# EAGLE design QTP-BAC 14.1 (EAGLE 7.5.0)
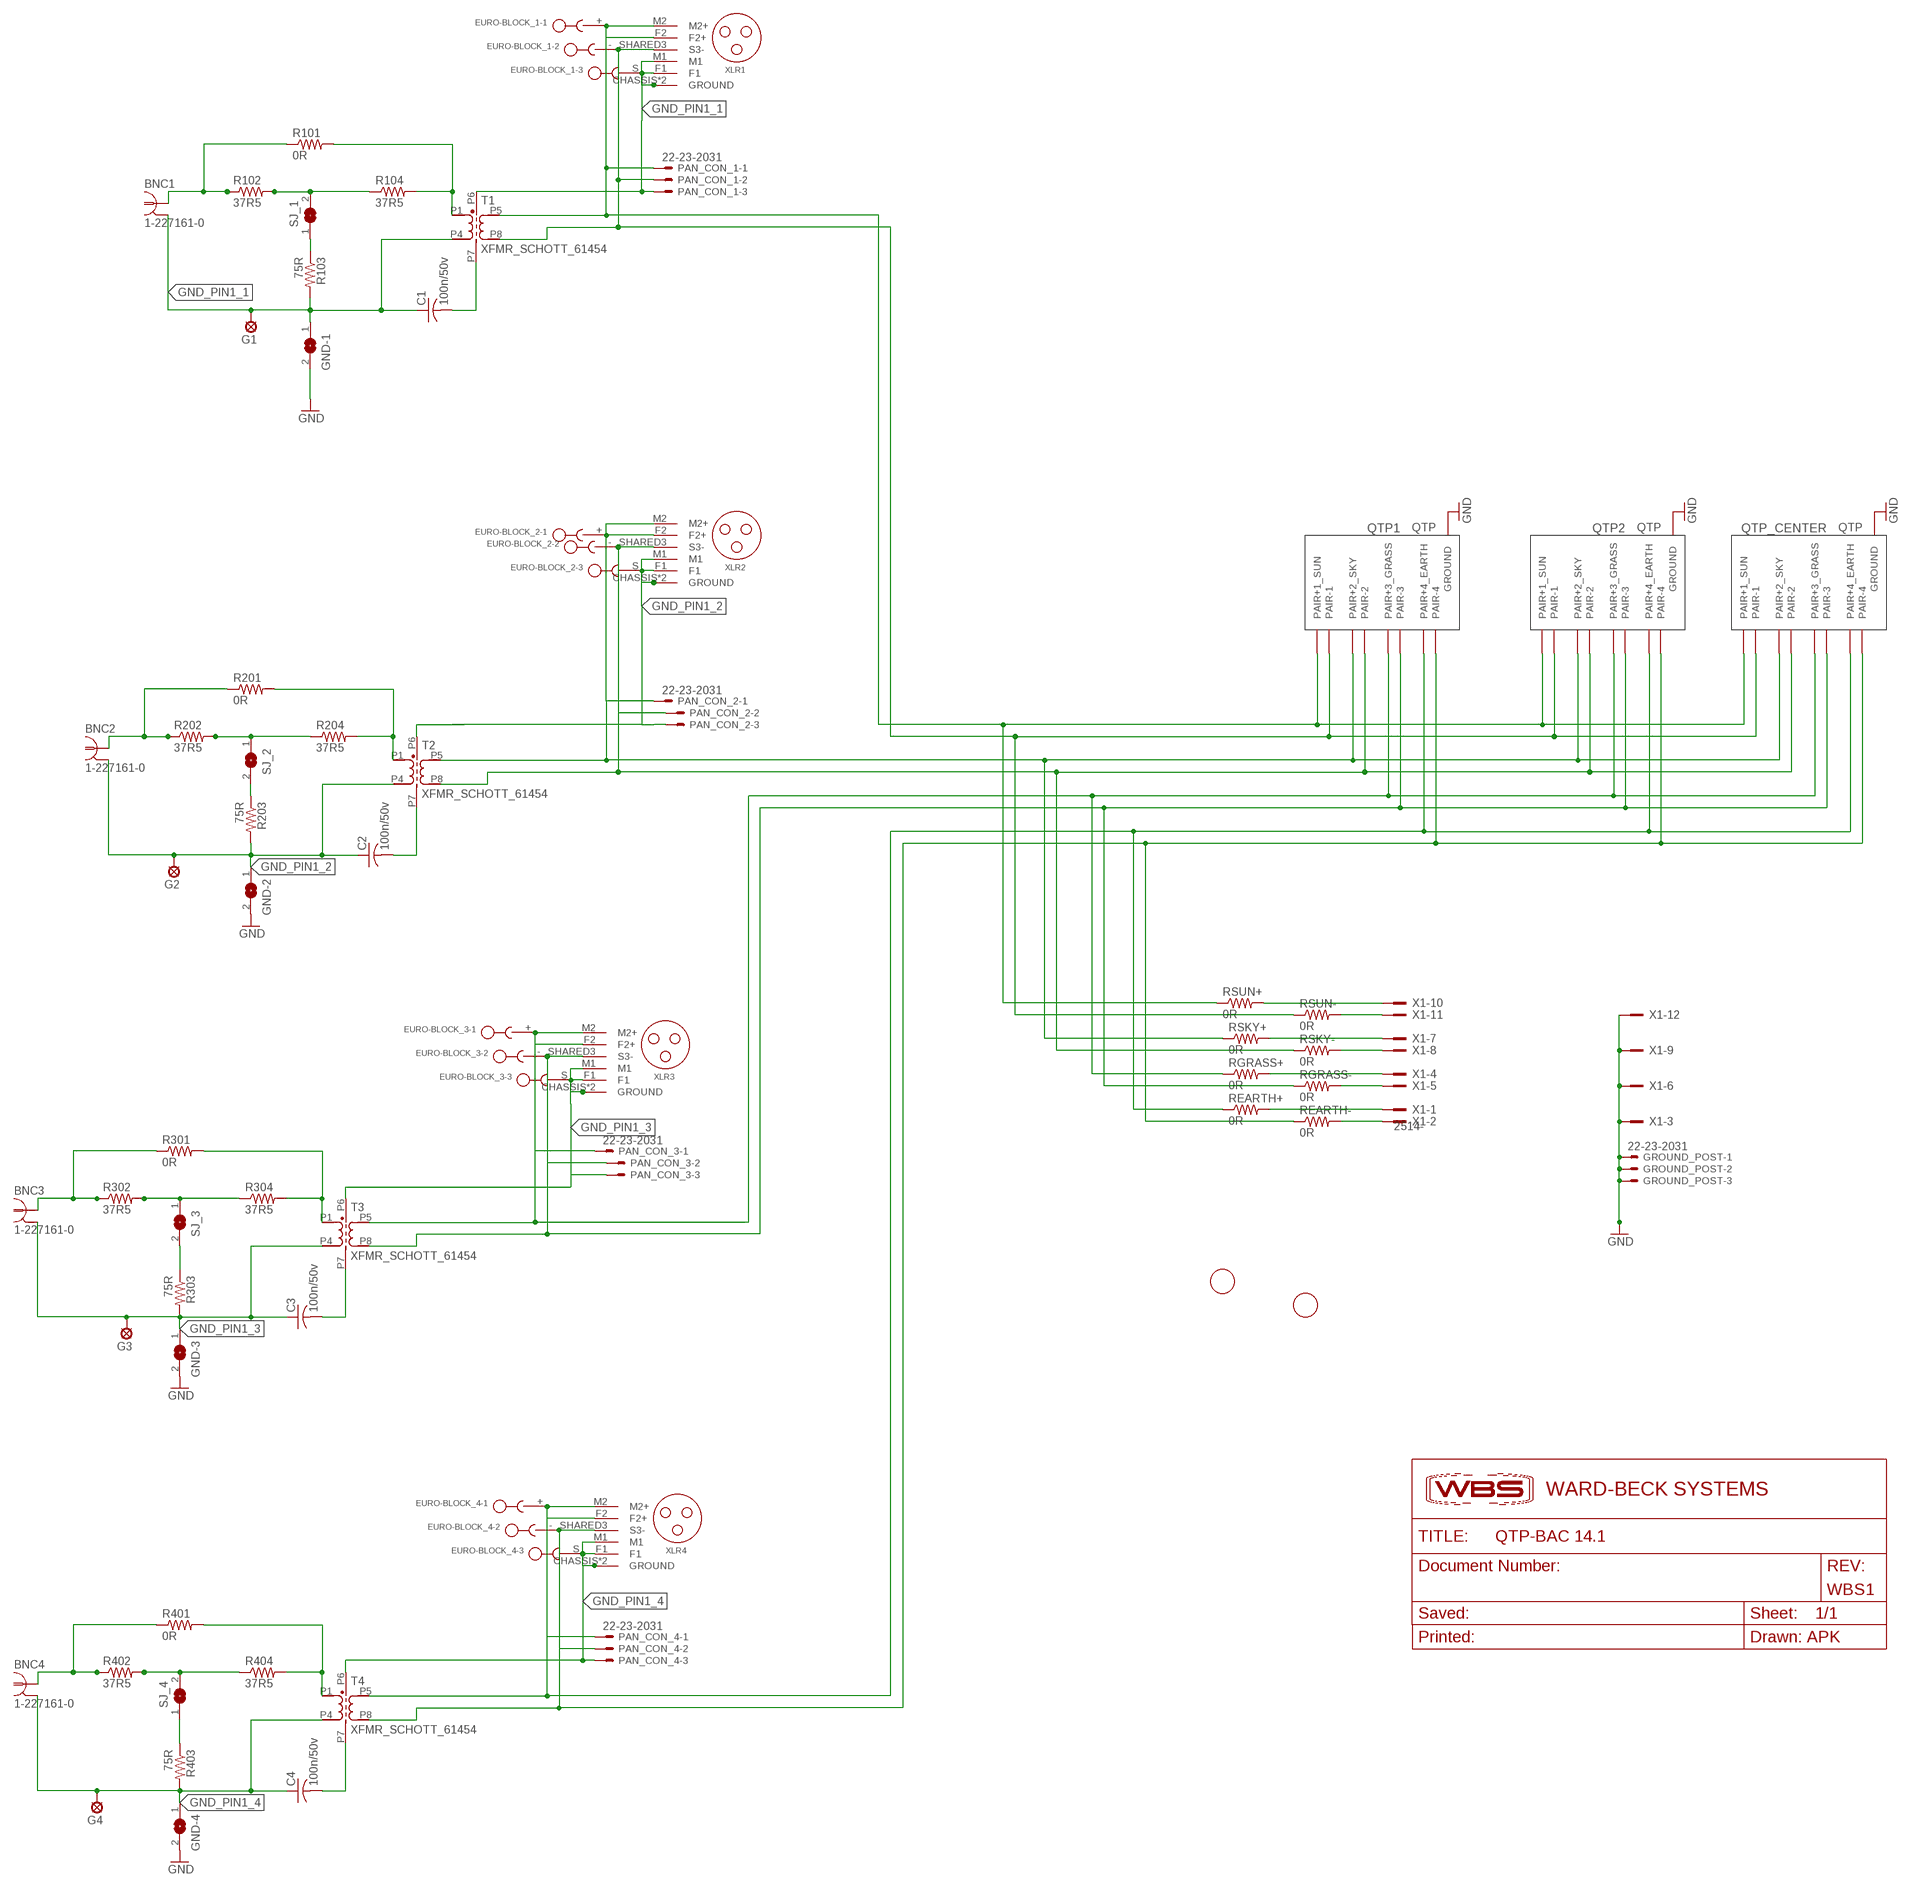
[diagram p0: schematic, sheet 1]

## Parts
BNC1  1-227161-0  [AMP_227161]
BNC2  1-227161-0  [AMP_227161]
BNC3  1-227161-0  [AMP_227161]
BNC4  1-227161-0  [AMP_227161]
C1  100n/50v  C-USC0805  [C0805]
C2  100n/50v  C-USC0805  [C0805]
C3  100n/50v  C-USC0805  [C0805]
C4  100n/50v  C-USC0805  [C0805]
EURO-BLOCK_1  CON-PHOENIX_RIGHT_ANGLE_3.81  [CON-PHOENIX_MC1.5/3-G-3.81]
EURO-BLOCK_2  CON-PHOENIX_RIGHT_ANGLE_3.81  [CON-PHOENIX_MC1.5/3-G-3.81]
EURO-BLOCK_3  CON-PHOENIX_RIGHT_ANGLE_3.81  [CON-PHOENIX_MC1.5/3-G-3.81]
EURO-BLOCK_4  CON-PHOENIX_RIGHT_ANGLE_3.81  [CON-PHOENIX_MC1.5/3-G-3.81]
G1  LSP10  [LSP10]
G2  LSP10  [LSP10]
G3  LSP10  [LSP10]
G4  LSP10  [LSP10]
GND-1  SJ  [SJ]
GND-2  SJ  [SJ]
GND-3  SJ  [SJ]
GND-4  SJ  [SJ]
GROUND_POST  22-23-2031  [22-23-2031]
PAN_CON_1  22-23-2031  [22-23-2031]
PAN_CON_2  22-23-2031  [22-23-2031]
PAN_CON_3  22-23-2031  [22-23-2031]
PAN_CON_4  22-23-2031  [22-23-2031]
QTP1  CON-QTP  [ASSMAN-RJ45]
QTP2  CON-QTP  [ASSMAN-RJ45]
QTP_CENTER  CON-QTP  [ASSMAN-RJ45]
R101  0R  R-US_R0805W  [R0805W]
R102  37R5  R-US_R0805W  [R0805W]
R103  75R  R-US_R0805W  [R0805W]
R104  37R5  R-US_R0805W  [R0805W]
R201  0R  R-US_R0805W  [R0805W]
R202  37R5  R-US_R0805W  [R0805W]
R203  75R  R-US_R0805W  [R0805W]
R204  37R5  R-US_R0805W  [R0805W]
R301  0R  R-US_R0805W  [R0805W]
R302  37R5  R-US_R0805W  [R0805W]
R303  75R  R-US_R0805W  [R0805W]
R304  37R5  R-US_R0805W  [R0805W]
R401  0R  R-US_R0805W  [R0805W]
R402  37R5  R-US_R0805W  [R0805W]
R403  75R  R-US_R0805W  [R0805W]
R404  37R5  R-US_R0805W  [R0805W]
REARTH+  0R  R-US_R0805W  [R0805W]
REARTH-  0R  R-US_R0805W  [R0805W]
RGRASS+  0R  R-US_R0805W  [R0805W]
RGRASS-  0R  R-US_R0805W  [R0805W]
RSKY+  0R  R-US_R0805W  [R0805W]
RSKY-  0R  R-US_R0805W  [R0805W]
RSUN+  0R  R-US_R0805W  [R0805W]
RSUN-  0R  R-US_R0805W  [R0805W]
SJ_1  SJ  [SJ]
SJ_2  SJ  [SJ]
SJ_3  SJ  [SJ]
SJ_4  SJ  [SJ]
T1  XFMR_SCHOTT_61454  [SCHOTT_61454]
T2  XFMR_SCHOTT_61454  [SCHOTT_61454]
T3  XFMR_SCHOTT_61454  [SCHOTT_61454]
T4  XFMR_SCHOTT_61454  [SCHOTT_61454]
U$1  FIDUCIAL  [FIDUCIAL_1MM]
U$2  FIDUCIAL  [FIDUCIAL_1MM]
WBS1  WBS-DOCUMENT_INFO_FRAME  [WBS-FRAME_PCB]
X1  2514-  [PAK100/2500-14]
XLR1  CON-XLR-NEUTRIK_A_BISEXUAL  [CON_NEUTRIK_A_BISEXUAL_H]
XLR2  CON-XLR-NEUTRIK_A_BISEXUAL  [CON_NEUTRIK_A_BISEXUAL_H]
XLR3  CON-XLR-NEUTRIK_A_BISEXUAL  [CON_NEUTRIK_A_BISEXUAL_H]
XLR4  CON-XLR-NEUTRIK_A_BISEXUAL  [CON_NEUTRIK_A_BISEXUAL_H]

## Nets
CH1+1 [Pair 1]: EURO-BLOCK_1.+ PAN_CON_1.1 QTP1.P1+(PAIR+1_SUN) QTP2.P1+(PAIR+1_SUN) QTP_CENTER.P1+(PAIR+1_SUN) RSUN+.1 T1.P5 XLR1.F2(F2+) XLR1.M2(M2+)
CH1-1 [Pair 1]: EURO-BLOCK_1.- PAN_CON_1.2 QTP1.P1-(PAIR-1) QTP2.P1-(PAIR-1) QTP_CENTER.P1-(PAIR-1) RSUN-.1 T1.P8 XLR1.SHARED3(S3-)
CH2+1 [Pair 2]: EURO-BLOCK_2.+ PAN_CON_2.1 QTP1.P2+(PAIR+2_SKY) QTP2.P2+(PAIR+2_SKY) QTP_CENTER.P2+(PAIR+2_SKY) RSKY+.1 T2.P5 XLR2.F2(F2+) XLR2.M2(M2+)
CH2-1 [Pair 2]: EURO-BLOCK_2.- PAN_CON_2.2 QTP1.P2-(PAIR-2) QTP2.P2-(PAIR-2) QTP_CENTER.P2-(PAIR-2) RSKY-.1 T2.P8 XLR2.SHARED3(S3-)
CH3+1 [Pair 3]: EURO-BLOCK_3.+ PAN_CON_3.1 QTP1.P3+(PAIR+3_GRASS) QTP2.P3+(PAIR+3_GRASS) QTP_CENTER.P3+(PAIR+3_GRASS) RGRASS+.1 T3.P5 XLR3.F2(F2+) XLR3.M2(M2+)
CH3-1 [Pair 3]: EURO-BLOCK_3.- PAN_CON_3.2 QTP1.P3-(PAIR-3) QTP2.P3-(PAIR-3) QTP_CENTER.P3-(PAIR-3) RGRASS-.1 T3.P8 XLR3.SHARED3(S3-)
CH4+1 [Pair 4]: EURO-BLOCK_4.+ PAN_CON_4.1 QTP1.P4+(PAIR+4_EARTH) QTP2.P4+(PAIR+4_EARTH) QTP_CENTER.P4+(PAIR+4_EARTH) REARTH+.1 T4.P5 XLR4.F2(F2+) XLR4.M2(M2+)
CH4-1 [Pair 4]: EURO-BLOCK_4.- PAN_CON_4.2 QTP1.P4-(PAIR-4) QTP2.P4-(PAIR-4) QTP_CENTER.P4-(PAIR-4) REARTH-.1 T4.P8 XLR4.SHARED3(S3-)
GND: GND-1.2 GND-2.2 GND-3.2 GND-4.2 GROUND_POST.1 GROUND_POST.2 GROUND_POST.3 QTP1.P$9(GROUND) QTP1.P$10(GROUND) QTP1.P$11(GROUND) QTP1.P$12(GROUND) QTP2.P$9(GROUND) QTP2.P$10(GROUND) QTP2.P$11(GROUND) QTP2.P$12(GROUND) QTP_CENTER.P$9(GROUND) QTP_CENTER.P$10(GROUND) QTP_CENTER.P$11(GROUND) QTP_CENTER.P$12(GROUND) X1.3 X1.6 X1.9 X1.12
GND_PIN1_1 [Pair 4]: BNC1.2 C1.1 EURO-BLOCK_1.S G1.MP GND-1.1 PAN_CON_1.3 R103.2 T1.P4 T1.P6 XLR1.CHASSIS(GROUND) XLR1.F1 XLR1.GROUND XLR1.M1
GND_PIN1_2 [Pair 4]: BNC2.2 C2.1 EURO-BLOCK_2.S G2.MP GND-2.1 PAN_CON_2.3 R203.2 T2.P4 T2.P6 XLR2.CHASSIS(GROUND) XLR2.F1 XLR2.GROUND XLR2.M1
GND_PIN1_3 [Pair 4]: BNC3.2 C3.1 EURO-BLOCK_3.S G3.MP GND-3.1 PAN_CON_3.3 R303.2 T3.P4 T3.P6 XLR3.CHASSIS(GROUND) XLR3.F1 XLR3.GROUND XLR3.M1
GND_PIN1_4 [Pair 4]: BNC4.2 C4.1 EURO-BLOCK_4.S G4.MP GND-4.1 PAN_CON_4.3 R403.2 T4.P4 T4.P6 XLR4.CHASSIS(GROUND) XLR4.F1 XLR4.GROUND XLR4.M1
N$1: R102.2 R104.1 SJ_1.2
N$2 [Pair 1]: C1.2 T1.P7
N$3 [Pair 1]: R101.2 R104.2 T1.P1
N$4: R103.1 SJ_1.1
N$5 [Pair 1]: BNC1.1 R101.1 R102.1
N$6: R203.1 SJ_2.2
N$7: R303.1 SJ_3.2
N$9 [Pair 2]: R201.2 R204.2 T2.P1
N$10 [Pair 2]: R202.2 R204.1 SJ_2.1
N$11 [Pair 2]: BNC2.1 R201.1 R202.1
N$12 [Pair 2]: C2.2 T2.P7
N$15: R403.1 SJ_4.1
N$22 [Pair 3]: R301.2 R304.2 T3.P1
N$23 [Pair 3]: R302.2 R304.1 SJ_3.1
N$24 [Pair 3]: BNC3.1 R301.1 R302.1
N$25 [Pair 3]: C3.2 T3.P7
N$35 [Pair 4]: R401.2 R404.2 T4.P1
N$36 [Pair 4]: R402.2 R404.1 SJ_4.2
N$37 [Pair 4]: BNC4.1 R401.1 R402.1
N$38 [Pair 4]: C4.2 T4.P7
N$39 [Pair 1]: REARTH-.2 X1.2
N$40 [Pair 1]: REARTH+.2 X1.1
N$41 [Pair 2]: RGRASS-.2 X1.5
N$46 [Pair 4]: RSUN+.2 X1.10
N$47 [Pair 2]: RGRASS+.2 X1.4
N$48 [Pair 3]: RSKY-.2 X1.8
N$49 [Pair 3]: RSKY+.2 X1.7
N$50 [Pair 4]: RSUN-.2 X1.11
Unconnected: X1.13 X1.14

## Library data of the parts
BNC1-BNC4 = con-coax:?227161*: JACK, RIGHT ANGLE, 50 OHM, PCB, BNC Source: amp_227161.pdf; MF: TYCO ELECTRONICS; MPN: 1-227161; OC_FARNELL: unknown; OC_NEWARK: 33B3200
C1-C4 = rcl:C-US: CAPACITOR, American symbol
EURO-BLOCK_1-EURO-BLOCK_4 = APK - PARTS:CON-PHOENIX_RIGHT_ANGLE_3.81
G1-G4 = solpad:LSP10: SOLDER PAD drill 1.0 mm, distributor Buerklin, 12H555
GND-1-GND-4 SJ_1-SJ_4 = jumper:SJ: SMD solder JUMPER
GROUND_POST PAN_CON_1-PAN_CON_4 = con-molex:22-23-2031: .100" (2.54mm) Center Header - 3 Pin; MF: MOLEX; MPN: 22-23-2031; OC_FARNELL: 1462950; OC_NEWARK: 30C0862
QTP1 QTP2 QTP_CENTER = APK - PARTS:CON-QTP
R101-R104 R201-R204 R301-R304 R401-R404 REARTH+ REARTH- RGRASS+ RGRASS- RSKY+ RSKY- RSUN+ RSUN- = rcl:R-US_: RESISTOR, American symbol
T1-T4 = APK - PARTS:XFMR_SCHOTT_61454
U$1 U$2 = adafruit:FIDUCIAL: For use by pick and place machines to calibrate the vision/machine, 1mm By microbuilder.eu
WBS1 = APK - PARTS:WBS-DOCUMENT_INFO_FRAME
X1 = con-3m:2514-: 3M (TM) Pak 100 4-Wall Header Source: 3M; OC_FARNELL: unknown; OC_NEWARK: unknown
XLR1-XLR4 = APK - PARTS:CON-XLR-NEUTRIK_A_BISEXUAL

## Net classes
0 default: width 0.305 mm
1 Pair 1: width 0.305 mm
2 Pair 2: width 0.305 mm
3 Pair 3: width 0.305 mm
4 Pair 4: width 0.305 mm

## Board
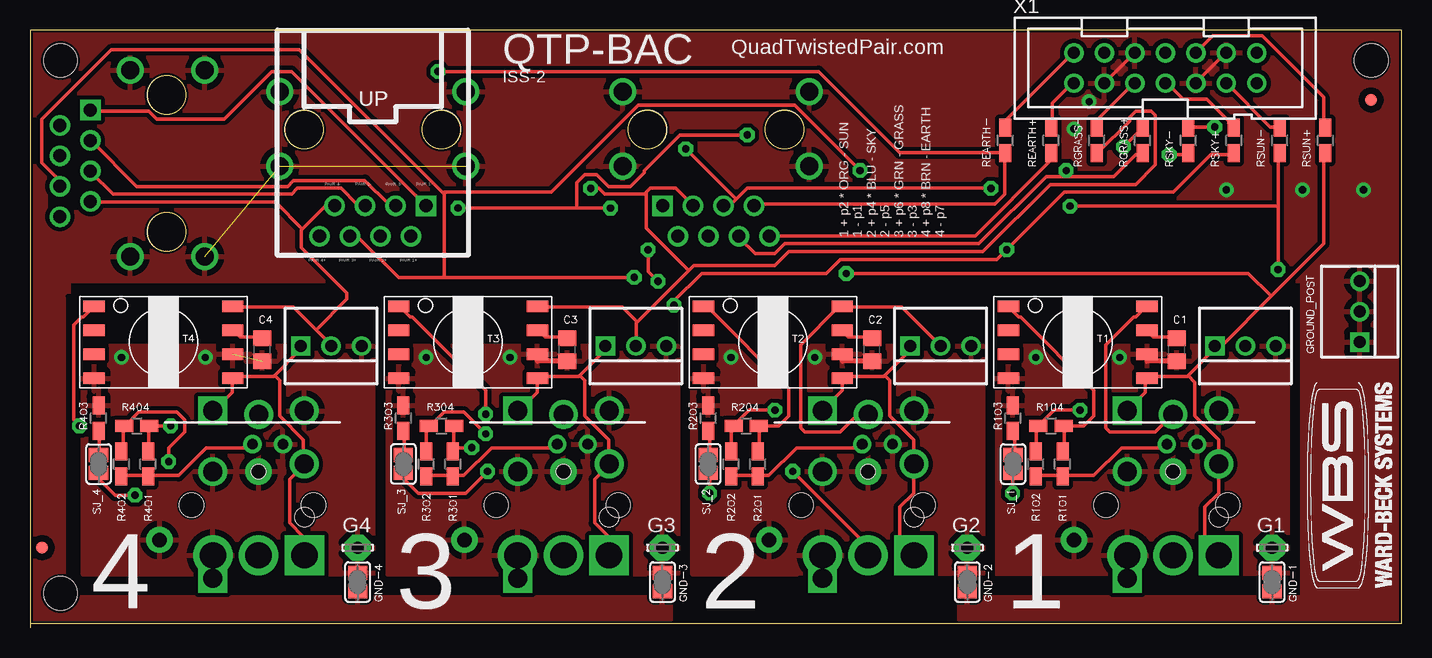
[diagram p1: board, top side]
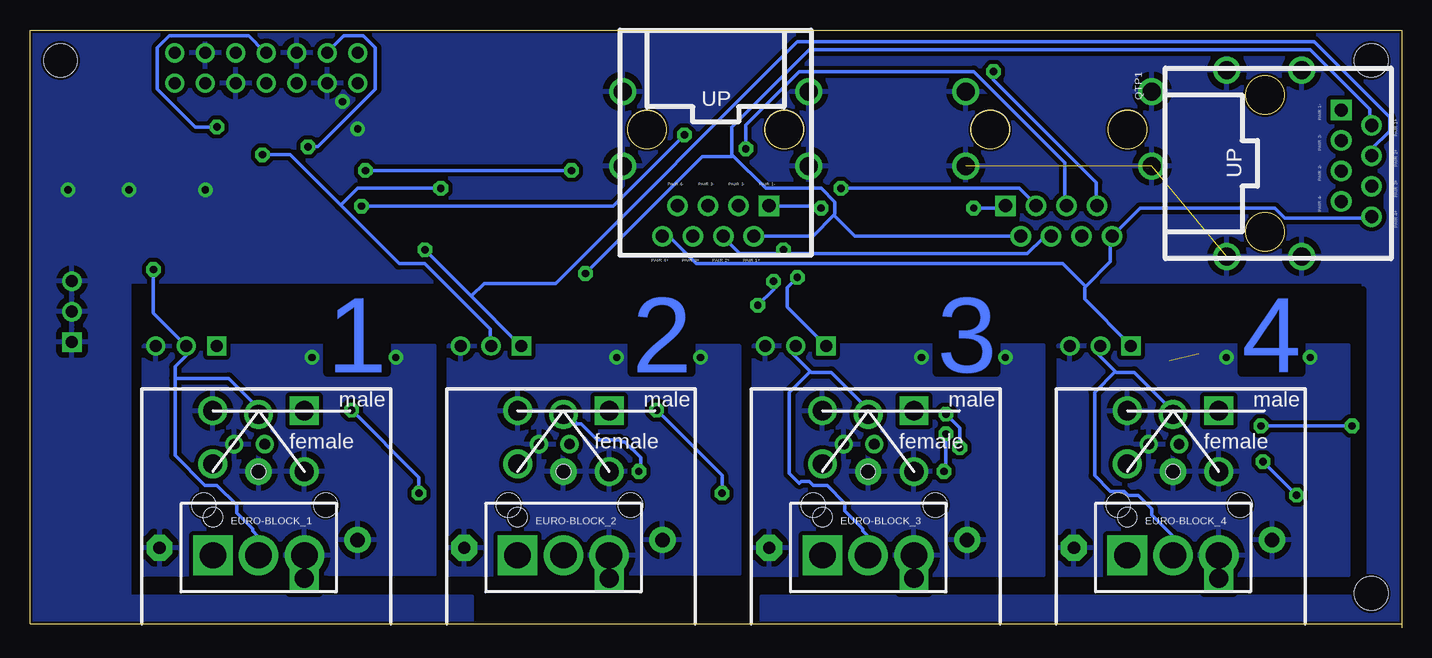
[diagram p2: board, bottom side, seen from below]

Size 114.3 x 49.85 mm. Coordinates in mm from the lower left corner, seen from the top.
Outline: 0,0.32 0,49.85 114.3,49.85 114.3,0.32 0,0.32
Outline: 0,0.32 0,0
Copper layers (1*16): Top 0.035mm / dielectric 1.5mm / Bottom 0.035mm
Design rules "LPKF Seneca Routing": minimum track width 12mil, minimum drill 24mil, track to track 14mil, track to pad 14mil, pad to pad 14mil, via to via 14mil, smd to smd 8mil, copper to edge 8mil, drill to drill 8mil, minimum pad ring 12mil, minimum via ring 12mil, stop-mask expansion 4mil, vias tented up to drill 0mil, thermal gap 20mil
Holes 2.8 mm at 111.76,47.31 2.54,47.31 2.54,2.86
tKeepout: area 1.8,35.1 to 3.8,36.1; 22 lines
bKeepout: area 1.5,35.1 to 3.6,36.4
tRestrict: area 1.5,34.9 to 3.8,36.4; 14 lines
bRestrict: area 1.5,34.9 to 3.8,36.4; 18 lines

### Footprints (pad centres in the part's own frame; a part is rotated, then mirrored left to right if it is on the bottom)
AMP_227161 = drill 0.9 pad 1.27: 1 0,-5.08; 2 -2.54,-5.08 | hole 2: -5.08,0; 5.08,0
C0805 = smd 1.3 x 1.5: 1 -0.95,0; 2 0.95,0
CON-PHOENIX_MC1.5/3-G-3.81 = drill 2.2 square: + 3.81,0 | drill 2.2: - 0,0; S -3.81,0
LSP10 = drill 1.016 pad 2.159 octagon: MP 0,0
SJ = smd 1.168 x 1.6: 1 -0.762,0; 2 0.762,0
22-23-2031 = drill 1 square: 1 2.54,0 | drill 1: 2 0,0; 3 -2.54,0
ASSMAN-RJ45 = drill 1.1: P1+ -3.162,17.196; P2+ -0.622,17.196; P2- 0.648,14.656; P3+ 1.918,17.196; P3- -1.892,14.656; P4+ 4.458,17.196; P4- 3.188,14.656 | drill 1.1 square: P1- -4.432,14.656 | drill 1.5: P$9 -7.744,5.131; P$10 7.767,5.131; P$11 -7.744,11.349; P$12 7.767,11.349 | hole 3.2: -5.702,8.306; 5.728,8.306 | hole 3.175: -5.702,8.306
R0805W = smd 1.5 x 1: 1 -1.052,0; 2 1.052,0
SCHOTT_61454 = smd 0.965 x 1.778: P1 -3.01,-5.779; P2 -1.003,-5.779; P3 1.003,-5.779; P4 3.01,-5.779; P5 3.01,5.779; P6 1.003,5.779; P7 -1.003,5.779; P8 -3.01,5.779
FIDUCIAL_1MM = smd 1 x 1: 1 0,0
PAK100/2500-14 = drill 1 pad 1.422: 1 -7.62,-1.27; 2 -7.62,1.27; 3 -5.08,-1.27; 4 -5.08,1.27; 5 -2.54,-1.27; 6 -2.54,1.27; 7 0,-1.27; 8 0,1.27; 9 2.54,-1.27; 10 2.54,1.27; 11 5.08,-1.27; 12 5.08,1.27; 13 7.62,-1.27; 14 7.62,1.27
CON_NEUTRIK_A_BISEXUAL_H = drill 1.2 pad 2.184: CHASSIS -8.25,7; GROUND 0,12.7 | drill 1.6: F1 -3.81,12.7; F2 3.81,13.335; M1 3.81,17.78; SHARED3 0,17.462 | drill 1.6 pad 2.032 square: FAKEHOLE -3.81,3.81 | drill 1.6 square: M2 -3.81,17.78 | hole 1.2: 0,12.7 | hole 1.6: 3.81,8.89

### Placement (x,y rotation side)
BNC1  94.74,10.22 180 top
BNC2  69.34,10.22 180 top
BNC3  43.94,10.22 180 top
BNC4  18.54,10.22 180 top
C1  95.57,23.18 90 top
C2  70.17,23.18 90 top
C3  44.77,23.18 90 top
C4  19.37,23.18 90 top
EURO-BLOCK_1  95.25,6.03 180 bottom
EURO-BLOCK_2  69.85,6.03 180 bottom
EURO-BLOCK_3  44.45,6.03 180 bottom
EURO-BLOCK_4  19.05,6.03 180 bottom
G1  103.5,6.67 0 top
G2  78.11,6.67 0 top
G3  52.7,6.67 0 top
G4  27.3,6.67 0 top
GND-1  103.5,3.81 270 top
GND-2  78.11,3.81 270 top
GND-3  52.7,3.81 270 top
GND-4  27.3,3.81 270 top
GROUND_POST  110.81,26.35 270 top
PAN_CON_1  101.28,23.49 180 top
PAN_CON_2  75.88,23.49 180 top
PAN_CON_3  50.5,23.49 180 top
PAN_CON_4  25.1,23.49 180 top
QTP1  19.68,38.73 270 bottom
QTP2  57.15,49.85 180 bottom
QTP_CENTER  28.57,49.85 180 top
R101  86.04,13.65 90 top
R102  83.82,13.65 90 top
R103  81.92,17.46 90 top
R104  85.09,16.83 0 top
R201  60.64,13.65 90 top
R202  58.42,13.65 90 top
R203  56.52,17.46 90 top
R204  59.69,16.83 0 top
R301  35.24,13.65 90 top
R302  33.02,13.65 90 top
R303  31.11,17.46 90 top
R304  34.29,16.83 0 top
R401  9.84,13.65 90 top
R402  7.62,13.65 90 top
R403  5.71,17.46 90 top
R404  8.89,16.83 0 top
REARTH+  85.09,40.64 90 top
REARTH-  81.28,40.64 90 top
RGRASS+  92.71,40.64 90 top
RGRASS-  88.9,40.64 90 top
RSKY+  100.33,40.64 90 top
RSKY-  96.52,40.64 90 top
RSUN+  107.95,40.64 90 top
RSUN-  104.14,40.64 90 top
SJ_1  81.92,13.65 270 top
SJ_2  56.52,13.65 90 top
SJ_3  31.11,13.65 90 top
SJ_4  5.71,13.65 270 top
T1  87.31,23.81 270 top
T2  61.91,23.81 270 top
T3  36.51,23.81 270 top
T4  11.11,23.81 270 top
U$1  1.02,6.67 0 top
U$2  111.76,44.01 0 top
U$4  [C1-4-150731-094535]  95.25,25.4 0 top
U$5  [C2-5-150731-094535]  69.85,25.4 0 top
U$6  [C3-6-150731-094535]  44.45,25.4 0 top
U$7  [C4-7-150731-094535]  19.05,25.4 0 top
U$9  [GND_1-8-150731-094535]  105.54,2.16 90 top
U$10  [GND_2-9-150731-094535]  80.14,2.16 90 top
U$11  [GND_3-10-150731-094535]  54.74,2.16 90 top
U$12  [GND_4-11-150731-094535]  29.34,2.16 90 top
U$13  [GROUND_P-12-150731-094535]  107,22.86 90 top
U$18  [R101-17-150731-094535]  86.36,8.89 90 top
U$19  [R102-18-150731-094535]  84.14,8.89 90 top
U$20  [R103-19-150731-094535]  80.96,16.51 90 top
U$21  [R104-20-150731-094535]  83.82,18.1 0 top
U$22  [R201-21-150731-094535]  60.96,8.89 90 top
U$23  [R202-22-150731-094535]  58.74,8.89 90 top
U$24  [R203-23-150731-094535]  55.56,16.51 90 top
U$25  [R204-24-150731-094535]  58.42,18.1 0 top
U$26  [R301-25-150731-094535]  35.56,8.89 90 top
U$27  [R302-26-150731-094535]  33.34,8.89 90 top
U$28  [R303-27-150731-094535]  30.16,16.51 90 top
U$29  [R304-28-150731-094535]  33.02,18.1 0 top
U$30  [R401-29-150731-094535]  10.16,8.89 90 top
U$31  [R402-30-150731-094535]  7.94,8.89 90 top
U$32  [R403-31-150731-094535]  4.76,16.51 90 top
U$33  [R404-32-150731-094535]  7.62,18.1 0 top
U$34  [REARTH_-33-150731-094535]  83.82,38.42 90 top
U$35  [REARTH_-34-150731-094535]  80.01,38.42 90 top
U$36  [RGRASS_-35-150731-094535]  91.44,38.42 90 top
U$37  [RGRASS_-36-150731-094535]  87.63,38.42 90 top
U$38  [RSKY_-37-150731-094535]  99.06,38.42 90 top
U$39  [RSKY_-38-150731-094535]  95.25,38.42 90 top
U$40  [RSUN_-39-150731-094535]  106.68,38.42 90 top
U$41  [RSUN_-40-150731-094535]  102.87,38.42 90 top
U$42  [SJ_1-41-150731-094535]  82.04,9.46 90 top
U$43  [SJ_2-42-150731-094536]  56.64,9.46 90 top
U$44  [SJ_3-43-150731-094536]  31.24,9.46 90 top
U$45  [SJ_4-44-150731-094536]  5.84,9.46 90 top
U$46  GND_PIN1_1  [T1-45-150731-094536]  88.9,23.81 0 top
U$47  GND_PIN1_2  [T2-46-150731-094536]  63.5,23.81 0 top
U$48  gnd  [T3-47-150731-094536]  38.1,23.81 0 top
U$49  gnd  [T4-48-150731-094536]  12.7,23.81 0 top
WBS1  12.7,-70.17 0 top  (outside the outline)
X1  94.61,46.67 0 top
XLR1  95.25,0.32 0 top
XLR2  69.85,0.32 0 top
XLR3  44.45,0.32 0 top
XLR4  19.05,0.32 0 top

### Tracks (layer width: path | path; a pad name or v marks a point on that pad's centre or on a via)
CH1+1  (via drill 0.61)
  Top 0.305: EURO-BLOCK_1.+ 99.06,6.1 97.9,7.25 97.9,10.06 99.06,11.21 XLR1.F2 99.06,15.67 97.08,17.65 97.08,20.46 96.5,21.04 | XLR1.M2 91.47,18.15 92.95,19.63 92.95,20.79 T1.P5 93.12,20.95 96.42,20.95 96.5,21.04 | 103.44,27.64 99.39,23.6 98.89,23.6 PAN_CON_1.1 98.89,23.43 96.5,21.04 | 103.44,27.64 107.81,32.02 107.81,39.45 RSUN+.1 | 103.44,27.64 101.54,29.54 v68.02,29.54
  Bottom 0.305: 55.72,39.36 53,36.64 48.37,36.64 47.22,35.48 47.22,34.49 47.3,34.41 | 55.72,39.36 55.8,39.45 55.8,41.76 49.37,48.2 7.59,48.2 2.64,43.24 2.64,41.92 QTP1.P1+ | 47.3,34.41 49.03,32.68 53.99,32.68 QTP2.P1+ | 47.3,34.41 45.57,32.68 31.86,32.68 QTP_CENTER.P1+ | v68.02,29.54 58.28,39.28 55.8,39.28 55.72,39.36
CH1-1  (via drill 0.61)
  Top 0.305: T1.P8 92.95,26.73 92.13,25.91 91.96,25.91 89.65,23.6 89.65,16.66 89.98,16.33 93.78,16.33 95.1,17.65 XLR1.SHARED3 | v104.01,29.87 104.01,35.15 | 104.01,35.15 104.01,39.45 RSUN-.1 | QTP1.P1- 5.12,43.08 9.91,43.08 10.57,42.42 16.18,42.42 20.14,46.38 21.79,46.38 32.85,35.32 QTP_CENTER.P1- | v35.66,34.99 45.57,34.99 | 45.57,34.99 v48.37,34.99 | v86.68,35.15 104.01,35.15 | v59.77,41.1 54.15,41.1 51.18,38.13 51.18,37.96 50.02,36.8 48.21,36.8 47.22,37.8 46.23,37.8 45.57,37.13 45.57,34.99
  Bottom 0.305: v104.01,29.87 104.01,26.24 101.37,23.6 PAN_CON_1.2 101.21,23.43 101.21,22.77 102.2,21.78 102.2,20.79 | 102.2,20.79 102.2,14.35 99.72,11.87 98.73,11.87 97.08,10.22 97.08,9.56 95.76,8.24 95.76,8.08 95.26,7.58 95.26,6.1 EURO-BLOCK_1.- | 102.2,20.79 97.74,20.79 95.26,18.31 95.26,17.82 XLR1.SHARED3 | v48.37,34.99 48.54,35.15 52.67,35.15 QTP2.P1- | v35.66,34.99 33.19,34.99 33.02,35.15 QTP_CENTER.P1- | v86.68,35.15 65.71,35.15 v59.77,41.1
CH2+1  (via drill 0.61)
  Top 0.305: EURO-BLOCK_2.+ 73.64,6.1 72.48,7.25 72.48,10.06 73.64,11.21 73.64,13.53 XLR2.F2 73.64,13.69 73.64,15.67 71.65,17.65 71.65,20.62 71.24,21.04 | XLR2.M2 66.04,18.15 67.69,19.8 T2.P5 67.69,20.95 71.16,20.95 71.24,21.04 | RSKY+.1 100.22,39.45 98.4,39.45 95.26,36.31 86.18,36.31 v81.39,31.52 80.57,30.7 67.53,30.7 66.37,29.54 55.97,29.54 53.66,27.23 v53.66,26.9 | 71.24,21.04 73.3,23.1 73.3,23.43 PAN_CON_2.1 | v51.51,31.52 51.51,29.71 v52.34,28.88
  Bottom 0.305: 51.51,31.19 55.14,31.19 56.46,32.51 QTP2.P2+ | 51.51,31.19 31.2,31.19 29.88,32.51 29.22,32.51 QTP_CENTER.P2+ | 77.51,27.64 73.47,23.6 PAN_CON_2.1 | 77.51,27.64 v81.39,31.52 | 77.51,27.64 76.44,28.71 70.5,28.71 50.35,48.86 7.26,48.86 0.99,42.58 0.99,41.43 2.48,39.94 2.48,39.45 QTP1.P2+ | v51.51,31.52 51.51,31.19 | v52.34,28.88 52.34,28.22 v53.66,26.9
CH2-1  (via drill 0.61)
  Top 0.305: QTP_CENTER.P2- 27.9,35.32 27.24,35.32 25.92,36.64 22.29,36.64 21.79,36.14 6.93,36.14 5.12,37.96 QTP1.P2- | v94.93,39.45 96.42,39.45 RSKY-.1 | 67.69,26.73 72.64,26.73 PAN_CON_2.2 | 58.86,35.73 59.77,36.64 v80.07,36.64 | 58.86,35.73 58.45,35.32 57.95,35.32 QTP2.P2- | 67.69,26.73 67.36,26.73 64.22,23.6 64.22,16.66 64.55,16.33 67.53,16.33 68.85,17.65 69.84,17.65 XLR2.SHARED3 | 67.69,26.73 T2.P8 | v63.56,13.03 69.84,6.76 69.84,6.1 EURO-BLOCK_2.- | 58.86,35.73 v54.65,39.94
  Bottom 0.305: v94.93,39.45 92.62,39.45 88.41,35.24 | 88.41,35.24 83.54,30.37 81.39,30.37 75.95,24.92 75.95,23.6 PAN_CON_2.2 | v80.07,36.64 87.01,36.64 88.41,35.24 | v63.56,13.03 63.4,13.2 63.4,14.19 64.72,15.51 65.05,15.51 65.22,15.67 67.03,15.67 68.35,16.99 68.68,16.99 69.34,17.65 69.84,17.65 XLR2.SHARED3 | v54.65,39.94 54.65,41.92 50.19,46.38 35.66,46.38 28.07,38.79 28.07,35.32 QTP_CENTER.P2-
CH3+1  (via drill 0.61)
  Top 0.305: 86.35,37.63 84.7,37.63 79.08,32.02 62.9,32.02 62.08,31.19 60.43,31.19 59.11,32.51 QTP2.P3+ | 86.35,37.63 90.31,37.63 92.13,39.45 92.62,39.45 RGRASS+.1 | XLR3.M2 40.78,18.15 42.27,19.63 42.27,20.79 T3.P5 42.43,20.95 45.73,20.95 45.81,21.04 | 45.81,21.04 47.88,23.1 47.88,23.43 PAN_CON_3.1 | v50.35,29.21 34.51,29.21 | 34.51,29.21 30.71,29.21 27.41,32.51 26.75,32.51 QTP_CENTER.P3+ | 34.42,36.23 34.51,36.14 34.51,29.21 | 34.42,36.23 22.45,48.2 6.77,48.2 0.99,42.42 0.99,38.79 2.48,37.3 2.48,36.97 QTP1.P3+ | 45.81,21.04 46.23,20.62 46.23,17.65 48.21,15.67 48.21,13.69 XLR3.F2 48.21,13.53 47.05,12.37 47.05,8.74 48.21,7.58 48.21,6.1 EURO-BLOCK_3.+ | v86.35,38.13 86.35,37.63 | v69.18,38.13 63.73,43.57 50.69,43.57 43.42,36.31 34.51,36.31 34.42,36.23
  Bottom 0.305: v50.35,29.21 51.18,28.38 51.18,26.73 48.04,23.6 PAN_CON_3.1 | v69.18,38.13 v86.35,38.13
CH3-1  (via drill 0.61)
  Top 0.305: QTP_CENTER.P3- 30.38,35.32 29.88,35.32 27.9,37.3 21.96,37.3 21.46,36.8 8.91,36.8 5.12,40.6 QTP1.P3- | 50.6,25.5 50.52,25.41 50.52,23.6 PAN_CON_3.2 | 50.6,25.5 54.9,29.79 | 54.9,29.79 55.31,30.2 62.08,30.2 63.23,31.36 79.41,31.36 85.03,36.97 92.13,36.97 93.78,38.62 93.78,42.75 93.45,43.08 92.13,43.08 91.63,42.58 91.63,42.25 88.99,39.61 RGRASS-.1 | 50.6,25.5 49.37,26.73 42.43,26.73 T3.P8 | 51.35,36.14 51.35,33.34 54.9,29.79 | 51.35,36.14 51.35,36.31 51.68,36.64 53.82,36.64 55.14,35.32 QTP2.P3- | v46.72,36.64 47.38,36.64 47.88,36.14 51.35,36.14
  Bottom 0.305: 49.28,21.37 50.69,22.77 50.69,23.27 50.52,23.43 PAN_CON_3.2 | 49.28,21.37 49.2,21.29 47.55,21.29 44.58,18.31 44.58,17.82 XLR3.SHARED3 | 49.28,21.37 51.02,19.63 51.02,12.87 50.19,12.04 50.02,12.2 49.37,12.2 49.03,11.87 47.88,11.87 46.39,10.39 46.39,9.73 44.91,8.24 44.91,8.08 44.58,7.75 44.58,6.1 EURO-BLOCK_3.- | v46.72,36.64 31.86,36.64 30.54,35.32 QTP_CENTER.P3-
CH4+1
  Top 0.305: REARTH+.1 85.03,39.45 85.03,38.95 78.75,32.68 61.75,32.68 QTP2.P4+ | XLR4.M2 15.35,18.15 16.84,19.63 16.84,20.79 T4.P5 17,20.95 20.31,20.95 20.39,21.04 | 20.39,21.04 22.45,23.1 22.45,23.43 PAN_CON_4.1 | 20.39,21.04 20.8,20.62 20.8,17.65 22.78,15.67 22.78,13.69 XLR4.F2 22.78,13.53 21.63,12.37 21.63,8.74 22.78,7.58 22.78,6.1 EURO-BLOCK_4.+
  Bottom 0.305: 26.33,28.47 26.42,28.38 26.42,27.39 22.62,23.6 PAN_CON_4.1 | 26.33,28.47 24.27,30.53 24.27,32.51 QTP_CENTER.P4+ 24.11,32.68 21.79,34.99 10.57,34.99 9.74,34.16 2.64,34.16 QTP1.P4+ | 26.33,28.47 28.23,30.37 58.78,30.37 60.92,32.51 61.58,32.51 QTP2.P4+
CH4-1  (via drill 0.61)
  Top 0.305: QTP2.P4- 60.43,35.32 80.4,35.32 81.23,36.14 81.23,39.45 REARTH-.1 81.23,39.61 72.48,39.61 65.71,46.38 v34.01,46.38 | 23.86,24.83 25.09,23.6 PAN_CON_4.2 | 23.86,24.83 21.96,26.73 17,26.73 T4.P8 | 22.7,33.25 22.62,33.17 22.62,31.69 26.42,27.89 26.42,27.39 23.86,24.83 | 22.7,33.25 24.6,35.15 25.26,35.15 QTP_CENTER.P4- | 22.7,33.25 20.47,35.48 5.12,35.48 QTP1.P4-
  Bottom 0.305: 23.86,21.37 25.26,22.77 25.26,23.27 25.09,23.43 PAN_CON_4.2 | 23.86,21.37 23.77,21.29 22.29,21.29 19.15,18.15 19.15,17.82 XLR4.SHARED3 | 23.86,21.37 25.59,19.63 25.59,12.7 24.27,11.38 23.11,11.38 22.78,11.05 21.96,11.05 20.8,9.89 20.8,9.4 19.15,7.75 19.15,6.1 EURO-BLOCK_4.- | v34.01,46.38 34.01,45.72 25.43,37.13 25.43,35.32 QTP_CENTER.P4-
GND  (via drill 0.6)  (2 unrouted)
  Top 0.305: X1.6 91.96,47.87 89.65,45.55 X1.3 | X1.12 99.56,47.87 97.24,45.55 X1.9
  other vias: 99.69,36.51 106.05,36.51 111.12,36.51 88.27,43.88 87,41.59
  pour Top: 0,49.85 114.3,49.85 114.3,0.32 77.47,0.32 77.47,2.54 106.05,2.54 106.05,28.89 3.17,28.89 3.17,2.54 53.34,2.54 53.34,0.32 0,0.32
  pour Bottom: 0,49.85 114.3,49.85 114.3,0.32 77.47,0.32 77.47,2.54 106.05,2.54 106.05,28.89 3.17,28.89 3.17,2.54 53.34,2.54 53.34,0.32 0,0.32
GND_PIN1_1  (via drill 0.6)
  Top 0.406: C1.1 93.09,22.23 T1.P6
  other vias: 90.81,22.54 83.82,22.54
  pour Bottom: 80.64,23.49 80.64,4.45 104.78,4.45 104.78,23.49
  pour Top: 80.64,23.49 104.78,23.49 104.78,4.45 80.64,4.45
GND_PIN1_2  (via drill 0.6)
  Top 0.406: C2.1 67.69,22.23 T2.P6
  other vias: 65.41,22.54 58.42,22.54
  pour Bottom: 55.24,23.49 55.24,4.45 79.38,4.45 79.38,23.49
  pour Top: 55.24,23.49 79.38,23.49 79.38,4.45 55.24,4.45
GND_PIN1_3  (via drill 0.6)
  Top 0.406: C3.1 42.29,22.23 T3.P6
  other vias: 33.02,22.54 40.01,22.54
  pour Bottom: 29.84,23.49 53.98,23.49 53.98,4.45 29.84,4.45
  pour Top: 29.84,23.49 53.98,23.49 53.98,4.45 29.84,4.45
GND_PIN1_4  (via drill 0.6)  (1 unrouted)
  other vias: 7.62,22.54 14.61,22.54
  pour Bottom: 4.45,23.49 28.57,23.49 28.57,4.45 4.45,4.45
  pour Top: 4.45,23.49 28.57,23.49 28.57,4.45 4.45,4.45
N$1  (via drill 0.61)
  Top 0.305: R104.1 83.87,16.66 83.87,14.85 R102.2 | v81.89,11.21 81.89,12.87 SJ_1.2 | v87.5,18.15 85.36,18.15 R104.1 | R104.1
  Bottom 0.305: v81.89,11.21 81.89,12.53 v87.5,18.15
N$2
  Top 0.305: C1.2 95.43,24.26 93.61,24.26 93.12,24.75 T1.P7
N$3
  Top 0.305: 86.18,16.83 86.18,14.85 R101.2 | 86.18,16.83 87.83,16.83 88.66,17.65 88.66,19.8 82.55,25.91 82.39,25.91 81.56,26.73 T1.P1 | 86.18,16.83 R104.2
N$4
  Top 0.305: R103.1 82.06,16.33 82.06,14.52 SJ_1.1
N$5
  Top 0.305: R102.1 83.87,12.7 86.02,12.7 R101.1 86.18,12.7 88.66,12.7 90.97,15.01 94.6,15.01 BNC1.1
N$6
  Top 0.305: R203.1 56.63,16.33 56.63,14.52 SJ_2.2
N$7
  Top 0.305: R303.1 31.2,16.33 31.2,14.52 SJ_3.2
N$9
  Top 0.305: 60.76,16.83 60.76,14.85 R201.2 | 60.76,16.83 62.41,16.83 63.23,17.65 63.23,19.96 56.46,26.73 56.13,26.73 T2.P1 | 60.76,16.83 R204.2
N$10  (via drill 0.61)
  Top 0.305: 58.61,16.83 58.45,16.66 58.45,14.85 R202.2 | v56.63,11.21 56.63,12.87 SJ_2.1 | v62.08,18.15 59.93,18.15 58.61,16.83 | 58.61,16.83 R204.1
  Bottom 0.305: v56.63,11.21 56.63,12.7 v62.08,18.15
N$11
  Top 0.305: R202.1 58.45,12.7 60.59,12.7 R201.1 60.76,12.7 61.58,12.7 63.89,15.01 69.34,15.01 BNC2.1
N$12
  Top 0.305: C2.2 70.17,24.26 68.19,24.26 67.69,24.75 T2.P7
N$15
  Top 0.305: R403.1 5.78,16.33 5.78,14.52 SJ_4.1
N$22  (via drill 0.61)
  Top 0.305: 35.33,15.01 R304.2 | 35.33,15.01 35.33,14.85 R301.2 35.33,15.01 | v37.97,17.82 37.97,19.8 31.86,25.91 31.7,25.91 30.87,26.73 T3.P1 | 35.33,15.01 v36.82,15.01
  Bottom 0.305: v37.97,17.82 36.82,16.66 v36.82,15.01
N$23  (via drill 0.61)
  Top 0.305: R302.2 33.02,16.66 33.19,16.83 R304.1 33.35,16.83 34.51,17.98 36.16,17.98 v37.97,16.17 | v38.14,13.03 36.32,11.21 32.36,11.21 31.2,12.37 31.2,12.87 SJ_3.1
  Bottom 0.305: v38.14,13.03 37.97,13.2 v37.97,16.17
N$24
  Top 0.305: R302.1 33.02,12.7 35.17,12.7 R301.1 35.33,12.7 36.16,12.7 38.47,15.01 43.92,15.01 BNC3.1
N$25
  Top 0.305: C3.2 44.74,24.26 42.93,24.26 42.43,24.75 T3.P7
N$35  (via drill 0.61)
  Top 0.305: R401.2 9.91,14.85 9.91,16.83 R404.2 v11.72,16.83 | v4.13,16.83 3.63,17.32 3.63,25.25 4.29,25.91 4.46,25.91 5.28,26.73 T4.P1
  Bottom 0.305: v11.72,16.83 v4.13,16.83
N$36  (via drill 0.61)
  Top 0.305: R402.2 7.76,14.85 7.76,16.83 R404.1 7.92,16.83 9.08,17.98 12.22,17.98 12.88,17.32 12.88,16.33 11.56,15.01 v11.56,13.86 | v8.75,11.05 7.1,11.05 5.78,12.37 5.78,12.87 SJ_4.2
  Bottom 0.305: v11.56,13.86 v8.75,11.05
N$37
  Top 0.305: R402.1 7.76,12.7 9.74,12.7 R401.1 9.91,12.7 12.38,12.7 14.69,15.01 18.49,15.01 BNC4.1
N$38
  Top 0.305: C4.2 19.32,24.26 17.5,24.26 17,24.75 T4.P7
N$39
  Top 0.305: REARTH-.2 81.39,41.76 81.39,42.42 86.84,47.87 X1.2
N$40
  Top 0.305: REARTH+.2 85.19,41.76 85.19,43.74 86.84,45.39 X1.1
N$41
  Top 0.305: RGRASS-.2 88.99,41.76 88.99,42.42 91.96,45.39 X1.5
N$46
  Top 0.305: X1.10 98.56,49.35 102.69,49.35 107.81,44.23 107.81,41.76 RSUN+.2
N$47  (via drill 0.61)
  Top 0.305: v91.14,40.11 92.62,41.59 RGRASS+.2
  Bottom 0.305: v91.14,40.11 90.31,40.11 85.52,44.89 85.52,48.36 86.51,49.35 88.16,49.35 89.48,48.03 X1.4
N$48  (via drill 0.61)
  Top 0.305: v98.73,41.76 96.58,41.76 RSKY-.2
  Bottom 0.305: v98.73,41.76 100.55,41.76 103.68,44.89 103.68,48.36 102.69,49.35 96.09,49.35 94.77,48.03 X1.8
N$49
  Top 0.305: RSKY+.2 100.22,41.76 99.89,42.09 99.89,42.25 98.07,44.07 96.09,44.07 94.77,45.39 X1.7
N$50
  Top 0.305: RSUN-.2 104.01,41.76 103.35,41.76 99.72,45.39 X1.11

### Text on the board
Bottom: 4 | 3 | 2 | 1
tPlace: QTP-BAC | QuadTwistedPair.com | ISS-2 | 1 + p2 * ORG - SUN / 1 - p1 / 2 + p4 * BLU - SKY / 2 - p5 / 3 + p6 * GRN - GRASS / 3 - p3 / 4 + p8 * BRN - EARTH / 4 - p7 | 4 | 3 | 2 | 1